# Altium schematic sheet Esquematico.SchDoc
size Letter; Organization: Altium Limited; Address1: L3, 12a Rodborough Rd; Address2: Frenchs Forest; Address3: NSW; Address4: Australia 2086; SheetNumber: 1; SheetTotal: 1
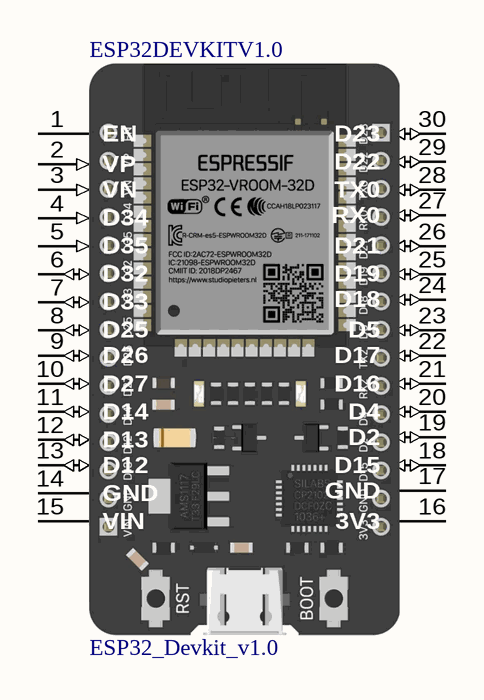
[diagram p0: Esquematico.SchDoc]

## Parts
ESP32DEVKITV1.0  ESP32_Devkit_v1.0  [ESP_32_DEKIT_V1.0]

## Nets

Not connected (* = marked no-connect by the designer): ESP32DEVKITV1.0 1(EN) 2(VP) 3(VN) 4(D34) 5(D35) 6(D32) 7(D33) 8(D25) 9(D26) 10(D27) 11(D14) 12(D13) 13(D12) 14(GND) 15(VIN) 16(3V3) 17(GND) 18(D15) 19(D2) 20(D4) 21(D16) 22(D17) 23(D5) 24(D18) 25(D19) 26(D21) 27(RX0) 28(TX0) 29(D22) 30(D23)

## Notes on the sheet
- Proyecto:
- Autor:
- Documento:
- Carnet:
- Curso:
- Revision:
- Fecha:
- Tamaño:
- Carta
- Hoja:
- De:

## Library data of the parts
ESP32DEVKITV1.0 = ESP32_Devkit_v1.0: ESP32 Development kit v1.0